# Altium project PamisBrainBoard.PrjPcb (part 2 of 2)

## Sheet SCH_main.SchDoc: Brain Board
size 297 x 209 mm; SPICEModelCacheJUPSVLAV: <root> / <DocumentId>JUPSVLAV</DocumentId> / </root>; DrawnBy: Adnan CATAL; SheetNumber: 2; SheetTotal: 3; Designer: Adnan CATAL; Projet: Pamis; Title2: MCU Schematic
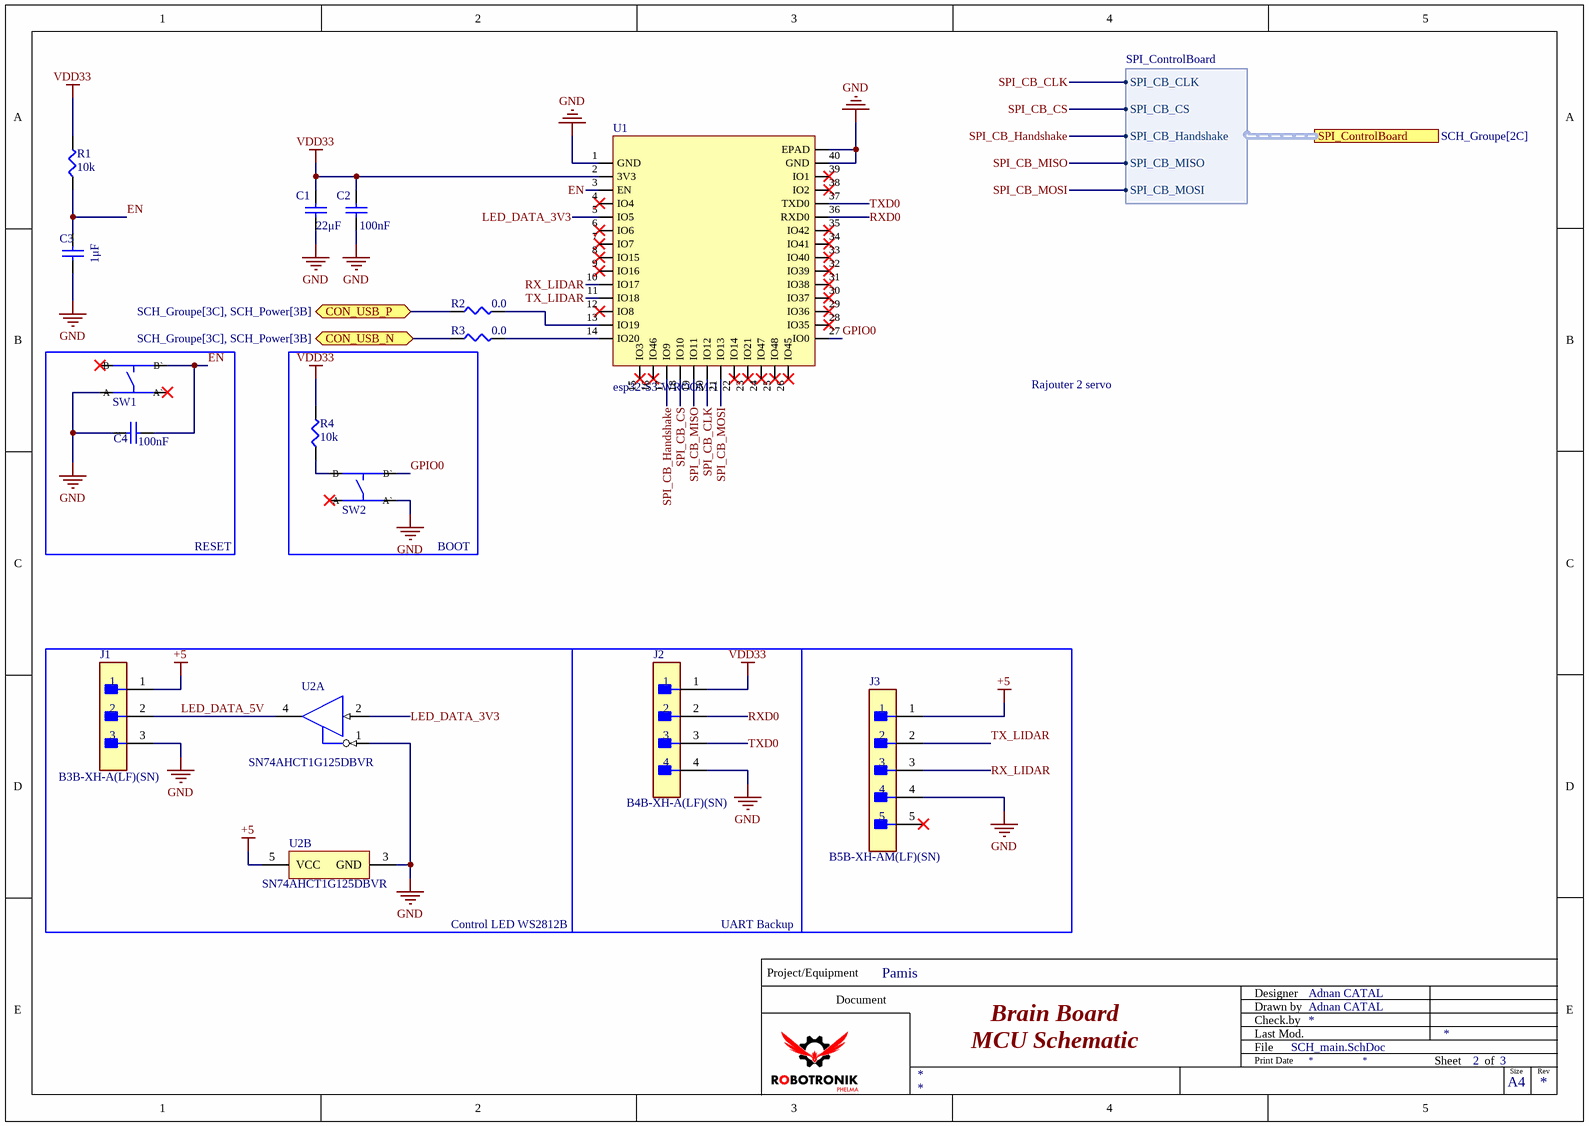
[diagram p2: SCH_main.SchDoc]

### Parts
C1  22μF  [WCAP-CSGP_0603_L1.6W0.8H0.8_Reflow]
C2  100nF  [WCAP-CSGP_0603_L1.6W0.8H0.8_Reflow]
C3  1μF  [WCAP-CSGP_0603_L1.6W0.8H0.8_Reflow]
C4  100nF  [WCAP-CSGP_0603_L1.6W0.8H0.8_Reflow]
J1  B3B-XH-A(LF)(SN)  [FP-B3B-XH-A_LF_SN-MFG]
J2  B4B-XH-A(LF)(SN)  [FP-B4B-XH-A_LF_SN-MFG]
J3  B5B-XH-AM(LF)(SN)  [FP-B5B-XH-AM_LF_SN-MFG]
R1  10k  [SMD-0603-RES]
R2  0.0  [SMD-0603-RES]
R3  0.0  [SMD-0603-RES]
R4  10k  [SMD-0603-RES]
SW1  EVQ-Q2S02W  [EVQQ2S02W]  (value not drawn)
SW2  EVQ-Q2S02W  [EVQQ2S02W]  (value not drawn)
U1  esp32-S3-WROOM-1  [XCVR_ESP32-S3-WROOM-1-N8R2]
U2  SN74AHCT1G125DBVR  [DBV0005A_L]  (parts A,B of 2)

### Blocks framed on the sheet
RESET: C4 SW1
BOOT: R4 SW2
Control LED WS2812B: J1 U2

### Ports
CON_USB_N (bidir, see SCH_Groupe[3C], SCH_Power[3B]), CON_USB_P (bidir, see SCH_Groupe[3C], SCH_Power[3B]), SPI_ControlBoard (harness SPI_ControlBoard, see SCH_Groupe[2C])

### Harnesses
SPI_ControlBoard: SPI_CB_MOSI, SPI_CB_MISO, SPI_CB_Handshake, SPI_CB_CS, SPI_CB_CLK

### Nets
+5: J1.1 J3.1 U2.5(VCC)
GND: C1.1 C2.2 C3.1 C4.1 J1.3 J2.4 J3.4 SW1.2(A) SW2.3(A`) U1.1(GND) U1.40(GND) U1.41_1,_41_2,_41_3,_41_4,_41_5,_41_6,_41_7,_41_8,_41_9,_41_10,_41_11,_41_12,_41_13,_41_14,_41_15,_41_16,_41_17,_41_18,_41_19,_41_20,_41_21(EPAD) U2.1(~{OE}) U2.3(GND)
VDD33: C1.2 C2.1 J2.1 R1.2 R4.2 U1.2(3V3)
CON_USB_N: R3.1 ; port CON_USB_N
CON_USB_P: R2.1 ; port CON_USB_P
EN: C3.2 C4.2 R1.1 SW1.4(B`) U1.3(EN)
GPIO0: SW2.4(B`) U1.27(IO0)
LED_DATA_3V3: U1.5(IO5) U2.2(A)
LED_DATA_5V: J1.2 U2.4(Y)
RX_LIDAR: J3.3 U1.10(IO17)
RXD0: J2.2 U1.36(RXD0)
SPI_CB_CLK: U1.20(IO12) ; port SPI_ControlBoard.SPI_CB_CLK
SPI_CB_CS: U1.18(IO10) ; port SPI_ControlBoard.SPI_CB_CS
SPI_CB_Handshake: U1.17(IO9) ; port SPI_ControlBoard.SPI_CB_Handshake
SPI_CB_MISO: U1.19(IO11) ; port SPI_ControlBoard.SPI_CB_MISO
SPI_CB_MOSI: U1.21(IO13) ; port SPI_ControlBoard.SPI_CB_MOSI
TX_LIDAR: J3.2 U1.11(IO18)
TXD0: J2.3 U1.37(TXD0)
NetR2_2: R2.2 U1.13(IO19)
NetR3_2: R3.2 U1.14(IO20)
NetR4_1: R4.1 SW2.1(B)

Not connected (* = marked no-connect by the designer): J3 5*; SW1 1(B)* 3(A`)*; SW2 2(A)*; U1 4(IO4)* 6(IO6)* 7(IO7)* 8(IO15)* 9(IO16)* 12(IO8)* 15(IO3)* 16(IO46)* 22(IO14)* 23(IO21)* 24(IO47)* 25(IO48)* 26(IO45)* 28(IO35)* 29(IO36)* 30(IO37)* 31(IO38)* 32(IO39)* 33(IO40)* 34(IO41)* 35(IO42)* 38(IO2)* 39(IO1)*

### Notes on the sheet
- Rajouter 2 servo
- UART Backup
- Project/Equipment
- Document
- Designer
- Drawn by
- Check.by
- File
- Last Mod.
- Print Date
- Sheet
- of
- Size
- A4
- Rev

### Library data of the parts
C1 = 885012106032: WCAP-CSGP Multilayer Ceramic Chip Capacitor, General Purpose, size 0603, 22μF, 10V; Manufacturer: Wurth Elektronik; Case/Size Code: 0603; Capacitance Tolerance: +/-20%; Ceramic Type: X5R Class II; Dissipation Factor: 20%; Insulation Resistance: 0.002GΩ; Technical Reference: X5R0603226M010DFCT10000; Manufacturer Part Number: 885012106032; Category: Multilayer Ceramic Chip Capacitors; Match Code: WCAP-CSGP; ComponentLink1Description: Website Link; ComponentLink1URL: https://www.we-online.com/redexpert/article/885012106032?ad; ComponentLink2Description: Datasheet Link; ComponentLink2URL: https://www.we-online.com/redexpert/spec/885012106032?ad; Mount: Surface Mount; Min Operating Temperature: -55°C; Max Operating Temperature: 85°C; Packaging: Tape and Reel; Length: 1.6mm; Width: 0.8mm; Height: 0.8mm; Capacitance: 22μF; Rated Voltage (DC): 10V
C2 C4 = 885012206046: WCAP-CSGP Multilayer Ceramic Chip Capacitor, General Purpose, size 0603, 100nF, 16V; Manufacturer: Wurth Elektronik; Case/Size Code: 0603; Capacitance Tolerance: +/-10%; Ceramic Type: X7R; Dissipation Factor: 3.5%; Insulation Resistance: 5GΩ; Technical Reference: X7R0603104K016DFCT10000; Manufacturer Part Number: 885012206046; Category: Multilayer Ceramic Chip Capacitors; Match Code: WCAP-CSGP; ComponentLink1Description: Website Link; ComponentLink1URL: https://www.we-online.com/redexpert/article/885012206046?ad; ComponentLink2Description: Datasheet Link; ComponentLink2URL: https://www.we-online.com/redexpert/spec/885012206046?ad; Mount: Surface Mount; Min Operating Temperature: -55°C; Max Operating Temperature: 125°C; Packaging: Tape and Reel; Length: 1.6mm; Width: 0.8mm; Height: 0.8mm; Capacitance: 100nF; Rated Voltage (DC): 16V
C3 = 885012106003: WCAP-CSGP Multilayer Ceramic Chip Capacitor, General Purpose, size 0603, 1μF, 6.3V; Manufacturer: Wurth Elektronik; Case/Size Code: 0603; Capacitance Tolerance: +/-20%; Ceramic Type: X5R; Dissipation Factor: 10%; Insulation Resistance: 0.1GΩ; Technical Reference: X5R0603105M6R3DFCT10000; Manufacturer Part Number: 885012106003; Category: Multilayer Ceramic Chip Capacitors; Match Code: WCAP-CSGP; ComponentLink1Description: Website Link; ComponentLink1URL: https://www.we-online.com/redexpert/article/885012106003?ad; ComponentLink2Description: Datasheet Link; ComponentLink2URL: https://www.we-online.com/redexpert/spec/885012106003?ad; Mount: Surface Mount; Min Operating Temperature: -55°C; Max Operating Temperature: 85°C; Packaging: Tape and Reel; Length: 1.6mm; Width: 0.8mm; Height: 0.8mm; Capacitance: 1μF; Rated Voltage (DC): 6.3V
J1 = CMP-17439-000014-3: CONN HEADER VERT 3POS 2.5MM; Max Voltage Rating (DC): 250V; Number of Positions: 3; Current Rating: 3A; Gender: Male; Wire/Cable Gauge: 22AWG; Contact Resistance: 20mR; Insulation Resistance: 1GR; Insulation Material: Nylon; Contact Plating: Tin; Depth: 5.75mm; Contact Type: Male Pin; Max Operating Temperature: 85°C; Insulation Color: Natural; Voltage Rating (AC): 250V; Color: Natural; Connector Type: Header; Orientation: Straight; Fastening Type: Detent; Housing Color: White; Min Operating Temperature: -25°C; Termination: Solder; Voltage Rating: 250V; Series: XH; Pitch: 2.5mm; Contact Shape: Square; Number of Rows: 1; Lead Free: Lead Free; Packaging: Bulk; Mount: Through Hole; Flammability Rating: UL94 V-0; Max Voltage Rating (AC): 250V; REACH SVHC: No SVHC; Housing Material: Polyamide; Contact Material: Brass; Lead Pitch: 2.5mm; Contact Finish - Mating: TIN; Length: 9.9mm; Max Current Rating: 3A; Number of Contacts: 3
J2 = CMP-17439-000250-1: CONN HEADER VERT 4POS 2.5MM; Number of Contacts: 4; Contact Resistance: 20mR; Voltage Rating: 250V; Max Current Rating: 3A; Gender: Male; Wire/Cable Gauge: 22AWG; Mated Stacking Heights: 9.8mm; Insulation Resistance: 1GR; Orientation: Straight; Contact Type: Male Pin; Contact Finish - Mating: TIN; Series: XH; Max Voltage Rating (AC): 250V; Lead Pitch: 2.5mm; Contact Shape: Square; Insulation Color: Natural; Termination: Solder; Lead Free: Lead Free; Voltage Rating (AC): 250V; Number of Rows: 1; Flammability Rating: UL94 V-0; Number of Positions: 4; Max Operating Temperature: 85°C; Package Quantity: 500; Mount: Through Hole; REACH SVHC: No SVHC; Connector Type: Header; Insulation Material: Nylon; Fastening Type: Detent; Min Operating Temperature: -25°C; Housing Color: White; Packaging: Bulk; Contact Plating: Tin; Contact Material: Brass; Max Voltage Rating (DC): 250V; Housing Material: Polyamide; Color: Natural; Material: Polyamide; Pitch: 2.5mm; Depth: 5.75mm; Current Rating: 3A; Length: 12.4mm
J3 = CMP-17439-000304-1: CONN HEADER VERT 5POS 2.5MM; Mated Stacking Heights: 9.8mm; Voltage Rating: 250V; Max Current Rating: 3A; Number of Positions: 5; Contact Resistance: 20mR; Depth: 5.75mm; Connector Type: Header; Color: Green; Insulation Material: Nylon; Contact Plating: Copper; Length: 14.9mm; Fastening Type: Detent; Contact Material: Brass; Number of Rows: 1; Contact Type: Male Pin; Housing Material: Polyamide; Housing Color: White; Lead Free: Lead Free; Max Voltage Rating (AC): 250V; Mount: Through Hole; Contact Shape: Square; Min Operating Temperature: -25°C; Packaging: Bulk; Orientation: Straight; Insulation Color: Natural; Series: XH; Flammability Rating: UL94 V-0; Contact Finish - Mating: TIN; Max Operating Temperature: 85°C; Termination: Solder; Pitch: 2.5mm
R1 R4 = ERJ-PA3F1002V: RES SMD 10K OHM 1% 1/4W 0603; Manufacturer: Panasonic Electronic Components; Factory Stock: 0; Unit Price (USD): 0.02372; @ qty: 1500; Minimum Quantity: 1; Power (Watts): 0.25W, 1/4W; Temperature Coefficient: ±100ppm/°C; Part Number: ERJ-PA3F1002V; Datasheets: https://industrial.panasonic.com/cdbs/www-data/pdf/RDA0000/AOA0000C243.pdf; Image: //media.digikey.com/Photos/Panasonic%20Photos/MFG_ERJ-P6W%20Series.jpg; Digi-Key Part Number: P10KBYCT-ND; Quantity Available: 12488; Packaging: Cut Tape (CT); Series: ERJ; Part Status: Active; Value: 10k; Tolerance: ±1%; Composition: Thick Film; Features: Automotive AEC-Q200, Pulse Withstanding; Operating Temperature: -55°C ~ 155°C; Package / Case: 0603 (1608 Metric); Supplier Device Package: 0603; Size / Dimension: 0.063" L x 0.031" W (1.60mm x 0.80mm); Height - Seated (Max): 0.022" (0.55mm); Number of Terminations: 2; Failure Rate: -
R2 R3 = ERJ-3GEY0R00V: RES SMD 0.0OHM JUMPER 1/10W 0603; Manufacturer: Panasonic Electronic Components; Factory Stock: 0; Unit Price (USD): 0.00352; @ qty: 1500; Minimum Quantity: 1; Power (Watts): 0.1W, 1/10W; Part Number: ERJ-3GEY0R00V; Datasheets: http://industrial.panasonic.com/www-cgi/jvcr13pz.cgi?E+PZ+3+AOA0001+ERJ3GEY0R00V+7+WW; Image: //media.digikey.com/Photos/Panasonic%20Photos/MFG_ERJ-P6W%20Series.jpg; Digi-Key Part Number: P0.0GCT-ND; Quantity Available: 4813372; Packaging: Cut Tape (CT); Series: ERJ; Part Status: Active; Value: 0.0; Tolerance: Jumper; Composition: Thick Film; Features: Automotive AEC-Q200; Temperature Coefficient: -; Operating Temperature: -55°C ~ 155°C; Package / Case: 0603 (1608 Metric); Supplier Device Package: 0603; Size / Dimension: 0.063" L x 0.031" W (1.60mm x 0.80mm); Height - Seated (Max): 0.022" (0.55mm); Number of Terminations: 2; Failure Rate: -
SW1 SW2 = EVQ-Q2S02W: Switch Tactile ON OFF SPST Round Button J-Bend 0.02A 15VDC 1.6N SMD Embossed T/R; Manufacturer: Panasonic; Manufacturer Lifecycle Status: ACTIVE; Actuator Length: 711.2µm; Actuator Material: Polyphthalamide; Contact Current Rating: 20mA; Contact Resistance: 100mΩ; Electrical Life: 1Mcycles; Illumination Type: Illuminated, Non-Illuminated; Max Voltage Rating (AC): 250V; Max Voltage Rating (DC): 15V; Number of Positions: 1; Switch Function: Off-Mom; Switch Travel: 250µm; Supplier: DigiKey; Supplier Part Number: P12951SCT-ND; Manufacturer Part Number: EVQ-Q2S02W; RoHS: Compliant; Category: Tactile Switches; Stock: 21774; Case/Package: SMD/SMT; Color: White; Contact Material: Brass, Stainless Steel; Contact Plating: Silver; Current Rating: 20mA; Depth: 6.6mm; Dielectric Material: Polyphthalamide; Height: 1.8mm; Housing Material: Stainless Steel; Insulation Resistance: 100MΩ; Lead Free: Lead Free; Length: 6.5mm; Life (Cycles): 1Mcycles; Lifecycle Status: Production; Max Current Rating: 20mA; Max Operating Temperature: 85°C; Mechanical Life: 1Mcycles; Min Operating Temperature: -40°C; Mounting Technology: Surface Mount; Operating Force: 1.6N; Radiation Hardening: No; REACH SVHC: Unaffected; Termination: Solder; Thickness: 1.8mm; Throw Configuration: SPST; Voltage Rating (AC): 250V; Voltage Rating (DC): 15V; Width: 6mm; ComponentLink1URL: https://datasheet.octopart.com:443/EVQ-Q2S02W-Panasonic-datasheet-138897726.pdf?src-supplier=Upverter; ComponentLink1Description: https://datasheet.octopart.com:443/EVQ-Q2S02W-Panasonic-datasheet-138897726.pdf?src-supplier=Upverter; ComponentLink2URL: https://datasheet.octopart.com:443/EVQ-Q2S02W-Panasonic-datasheet-59328990.pdf?src-supplier=IHS; ComponentLink2Description: https://datasheet.octopart.com:443/EVQ-Q2S02W-Panasonic-datasheet-59328990.pdf?src-supplier=IHS; ComponentLink3URL: https://datasheet.octopart.com/EVQ-Q2S02W-Panasonic-datasheet-13267673.pdf; ComponentLink3Description: https://datasheet.octopart.com/EVQ-Q2S02W-Panasonic-datasheet-13267673.pdf; ComponentLink4URL: https://datasheet.octopart.com:443/EVQ-Q2S02W-Panasonic-datasheet-41178988.pdf?src-supplier=element14+APAC; ComponentLink4Description: https://datasheet.octopart.com:443/EVQ-Q2S02W-Panasonic-datasheet-41178988.pdf?src-supplier=element14+APAC; ComponentLink5URL: https://datasheet.octopart.com:443/EVQ-Q2S02W-Panasonic-datasheet-130260655.pdf?src-supplier=TME; ComponentLink5Description: https://datasheet.octopart.com:443/EVQ-Q2S02W-Panasonic-datasheet-130260655.pdf?src-supplier=TME; ComponentLink6URL: https://datasheet.octopart.com:443/EVQ-Q2S02W-Panasonic-datasheet-78834757.pdf?src-supplier=Newark; ComponentLink6Description: https://datasheet.octopart.com:443/EVQ-Q2S02W-Panasonic-datasheet-78834757.pdf?src-supplier=Newark; ComponentLink7URL: https://datasheet.octopart.com:443/EVQQ2S02W-Panasonic-datasheet-5314136.pdf?src-supplier=Farnell; ComponentLink7Description: https://datasheet.octopart.com:443/EVQQ2S02W-Panasonic-datasheet-5314136.pdf?src-supplier=Farnell; ComponentLink8URL: https://datasheet.octopart.com:443/EVQ-Q2S02W-Panasonic-datasheet-106547821.pdf?src-supplier=Sager+Electronics; ComponentLink8Description: https://datasheet.octopart.com:443/EVQ-Q2S02W-Panasonic-datasheet-106547821.pdf?src-supplier=Sager+Electronics; ComponentLink9URL: https://datasheet.octopart.com:443/EVQ-Q2S02W-Panasonic-datasheet-98950118.pdf?src-supplier=Future+Electronics; ComponentLink9Description: https://datasheet.octopart.com:443/EVQ-Q2S02W-Panasonic-datasheet-98950118.pdf?src-supplier=Future+Electronics; ComponentLink10URL: https://datasheet.octopart.com:443/EVQ-Q2S02W-Panasonic-datasheet-118699.pdf?src-supplier=DigiKey; ComponentLink10Description: https://datasheet.octopart.com:443/EVQ-Q2S02W-Panasonic-datasheet-118699.pdf?src-supplier=DigiKey
U1 = esp32-S3-WROOM-1: Rf Txrx Module Bt Pcb Trace SMD; pin to pad: 41_1, 41_2, 41_3, 41_4, 41_5, 41_6, 41_7, 41_8, 41_9, 41_10, 41_11, 41_12, 41_13, 41_14, 41_15, 41_16, 41_17, 41_18, 41_19, 41_20, 41_21>41_1+41_2+41_3+41_4+41_5+41_6+41_7+41_8+41_9+41_10+41_11+41_12+41_13+41_14+41_15+41_16+41_17+41_18+41_19+41_20+41_21; Manufacturer: Espressif Systems; Manufacturer Part Number: ESP32-S3-WROOM-1-N4; Max Supply Voltage: 3.6V; Min Supply Voltage: 3V; Nominal Supply Voltage (DC): 3.3V; Supplier: DigiKey; Supplier Part Number: 1965-ESP32-S3-WROOM-1-N4TR-ND; RoHS: Compliant; Category: RF Receivers, Transceivers; Country of Origin: Vietnam; Height - Seated (Max): 3.25mm; Harmonized Tariff Schedule (HTS) Code: 8542.31.00.30; Length: 25.5mm; Max Operating Temperature: 85°C; Min Operating Temperature: -40°C; Number of Terminals: 41; REACH SVHC: Unaffected; Terminal Pitch: 1.27mm; Width: 18mm; ComponentLink1URL: https://datasheet.octopart.com:443/ESP32-S3-WROOM-1-N4-Espressif-Systems-datasheet-165560563.pdf?src-supplier=IHS; ComponentLink1Description: https://datasheet.octopart.com:443/ESP32-S3-WROOM-1-N4-Espressif-Systems-datasheet-165560563.pdf?src-supplier=IHS; ComponentLink2URL: https://datasheet.octopart.com:443/ESP32-S3-WROOM-1-N4-Espressif-Systems-datasheet-192340060.pdf?src-supplier=LCSC; ComponentLink2Description: https://datasheet.octopart.com:443/ESP32-S3-WROOM-1-N4-Espressif-Systems-datasheet-192340060.pdf?src-supplier=LCSC; ComponentLink3URL: https://datasheet.octopart.com:443/ESP32-S3-WROOM-1-N4-Espressif-Systems-datasheet-188867343.pdf?src-supplier=TME; ComponentLink3Description: https://datasheet.octopart.com:443/ESP32-S3-WROOM-1-N4-Espressif-Systems-datasheet-188867343.pdf?src-supplier=TME; ComponentLink4URL: https://datasheet.octopart.com:443/ESP32-S3-WROOM-1-N4-Espressif-Systems-datasheet-165560559.pdf?src-supplier=TME; ComponentLink4Description: https://datasheet.octopart.com:443/ESP32-S3-WROOM-1-N4-Espressif-Systems-datasheet-165560559.pdf?src-supplier=TME
U2 = CMP-0859-00079-3: Single Bus Buffer Gate With 3-State Output, DBV0005A, LARGE T&R; Manufacturer: Texas Instruments; Voltage(Nom)(V): 5; Schmitt Trigger: No; F @ Nom Voltage(Max)(Mhz): 75; Technology Family: AHCT; Logic: True; VCC(Max)(V): 5.5; Input Type: CMOS; Sub-Family: Non-Inverting Buffer/Driver; ICC @ Nom Voltage(Max)(mA): 0.01; Output Drive (IOL/IOH)(Max)(mA): 8/-8; VCC(Min)(V): 2; Rating: Catalog; Bits(#): 1; tpd @ Nom Voltage(Max)(ns): 6; 3-State Output: Yes; PackageReference: DBV0005A; DatasheetVersion: SCLS378M; Generic Part Number: SN74AHCT1G125; Output Type: CMOS; Operating Temperature Range(C): -40 to 125

## Nets that join several sheets
+5: SCH_Power (9 pins), SCH_main (J1.1 J3.1 U2.5)
GND: SCH_Groupe (J5.7), SCH_Power (35 pins), SCH_main (14 pins)
Vbat: SCH_Groupe (J5.6), SCH_Power (C14.2 R12.2 U5.2)
VDD33: SCH_Power (6 pins), SCH_main (6 pins)
CON_USB_N: SCH_Power (D3.2 J4.A6 J4.B6), SCH_main (R3.1)
CON_USB_P: SCH_Power (D2.2 J4.A7 J4.B7), SCH_main (R2.1)
SPI_CB_CLK: SCH_Groupe (J5.1), SCH_main (U1.20)
SPI_CB_CS: SCH_Groupe (J5.2), SCH_main (U1.18)
SPI_CB_Handshake: SCH_Groupe (J5.3), SCH_main (U1.17)
SPI_CB_MISO: SCH_Groupe (J5.4), SCH_main (U1.19)
SPI_CB_MOSI: SCH_Groupe (J5.5), SCH_main (U1.21)